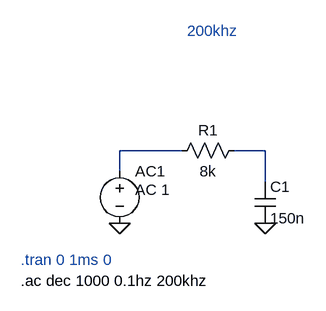
[diagram p0: schematic E1.asc]
E1.asc, the LTspice schematic file:
Version 4.1
SHEET 1 880 680
WIRE 160 112 64 112
WIRE 288 112 240 112
WIRE 64 144 64 112
WIRE 288 160 288 112
FLAG 288 224 0
FLAG 64 224 0
SYMBOL cap 272 160 R0
SYMATTR InstName C1
SYMATTR Value 150n
SYMBOL res 256 96 R90
WINDOW 0 0 56 VBottom 2
WINDOW 3 32 56 VTop 2
SYMATTR InstName R1
SYMATTR Value 8k
SYMBOL voltage 64 128 R0
WINDOW 3 24 44 Left 2
WINDOW 123 24 44 Left 2
WINDOW 39 0 0 Left 0
SYMATTR Value ""
SYMATTR Value2 AC 1
SYMATTR InstName AC1
TEXT -88 280 Left 2 ;.tran 0 1ms 0
TEXT 168 -72 Left 2 ;200khz
TEXT -88 312 Left 2 !.ac dec 1000 0.1hz 200khz

The netlist it stands for:
* E1.asc
C1 N002 0 150n
R1 N002 N001 8k
V§AC1 N001 0 AC 1
* .tran 0 1ms 0
* 200khz
.ac dec 1000 0.1hz 200khz
.backanno
.end